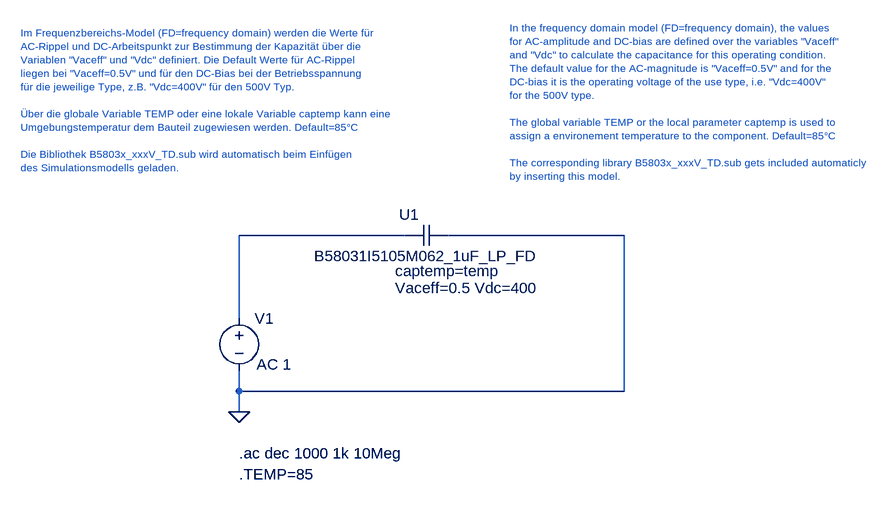
[diagram p0: schematic Testbench_B5803x_FD.asc]
Testbench_B5803x_FD.asc, the LTspice schematic file:
Version 4.1
SHEET 1 1228 680
WIRE 288 80 32 80
WIRE 624 80 352 80
WIRE 32 208 32 80
WIRE 32 320 32 288
WIRE 624 320 624 80
WIRE 624 320 32 320
WIRE 32 352 32 320
FLAG 32 352 0
SYMBOL voltage 32 192 R0
WINDOW 3 5 104 Left 2
WINDOW 123 27 87 Left 2
WINDOW 39 0 0 Left 2
SYMATTR Value ""
SYMATTR Value2 AC 1
SYMATTR InstName V1
SYMBOL TDK\\B5803x_500V_FD 320 80 R0
SYMATTR InstName U1
TEXT 32 448 Left 2 !.TEMP=85
TEXT -304 -232 Left 1 ;Im Frequenzbereichs-Model (FD=frequency domain) werden die Werte für \nAC-Rippel und DC-Arbeitspunkt zur Bestimmung der Kapazität über die \nVariablen "Vaceff" und "Vdc" definiert. Die Default Werte für AC-Rippel\nliegen bei "Vaceff=0.5V" und für den DC-Bias bei der Betriebsspannung \nfür die jeweilige Type, z.B. "Vdc=400V" für den 500V Typ.\n \nÜber die globale Variable TEMP oder eine lokale Variable captemp kann eine\nUmgebungstemperatur dem Bauteil zugewiesen werden. Default=85°C\n \nDie Bibliothek B5803x_xxxV_TD.sub wird automatisch beim Einfügen \ndes Simulationsmodells geladen.
TEXT 448 -240 Left 1 ;In the frequency domain model (FD=frequency domain), the values \nfor AC-amplitude and DC-bias are defined over the variables "Vaceff"\nand "Vdc" to calculate the capacitance for this operating condition.\nThe default value for the AC-magnitude is "Vaceff=0.5V" and for the\nDC-bias it is the operating voltage of the use type, i.e. "Vdc=400V"\nfor the 500V type.\n \nThe global variable TEMP or the local parameter captemp is used to \nassign a environement temperature to the component. Default=85°C\n \nThe corresponding library B5803x_xxxV_TD.sub gets included automaticly \nby inserting this model.
TEXT 32 416 Left 2 !.ac dec 1000 1k 10Meg

The netlist it stands for:
* Testbench_B5803x_FD.asc
V1 N001 0 AC 1
X§U1 N001 0 B58031I5105M062_1uF_LP_FD captemp=temp Vaceff=0.5 Vdc=400  ; pins A1 A2
.TEMP=85
* Im Frequenzbereichs-Model (FD=frequency domain) werden die Werte für
* AC-Rippel und DC-Arbeitspunkt zur Bestimmung der Kapazität über die
* Variablen "Vaceff" und "Vdc" definiert. Die Default Werte für AC-Rippel
* liegen bei "Vaceff=0.5V" und für den DC-Bias bei der Betriebsspannung
* für die jeweilige Type, z.B. "Vdc=400V" für den 500V Typ.
* Über die globale Variable TEMP oder eine lokale Variable captemp kann eine
* Umgebungstemperatur dem Bauteil zugewiesen werden. Default=85°C
* Die Bibliothek B5803x_xxxV_TD.sub wird automatisch beim Einfügen
* des Simulationsmodells geladen.
* In the frequency domain model (FD=frequency domain), the values
* for AC-amplitude and DC-bias are defined over the variables "Vaceff"
* and "Vdc" to calculate the capacitance for this operating condition.
* The default value for the AC-magnitude is "Vaceff=0.5V" and for the
* DC-bias it is the operating voltage of the use type, i.e. "Vdc=400V"
* for the 500V type.
* The global variable TEMP or the local parameter captemp is used to
* assign a environement temperature to the component. Default=85°C
* The corresponding library B5803x_xxxV_TD.sub gets included automaticly
* by inserting this model.
.ac dec 1000 1k 10Meg
.lib B5803x_500V_FD.sub
.backanno
.end